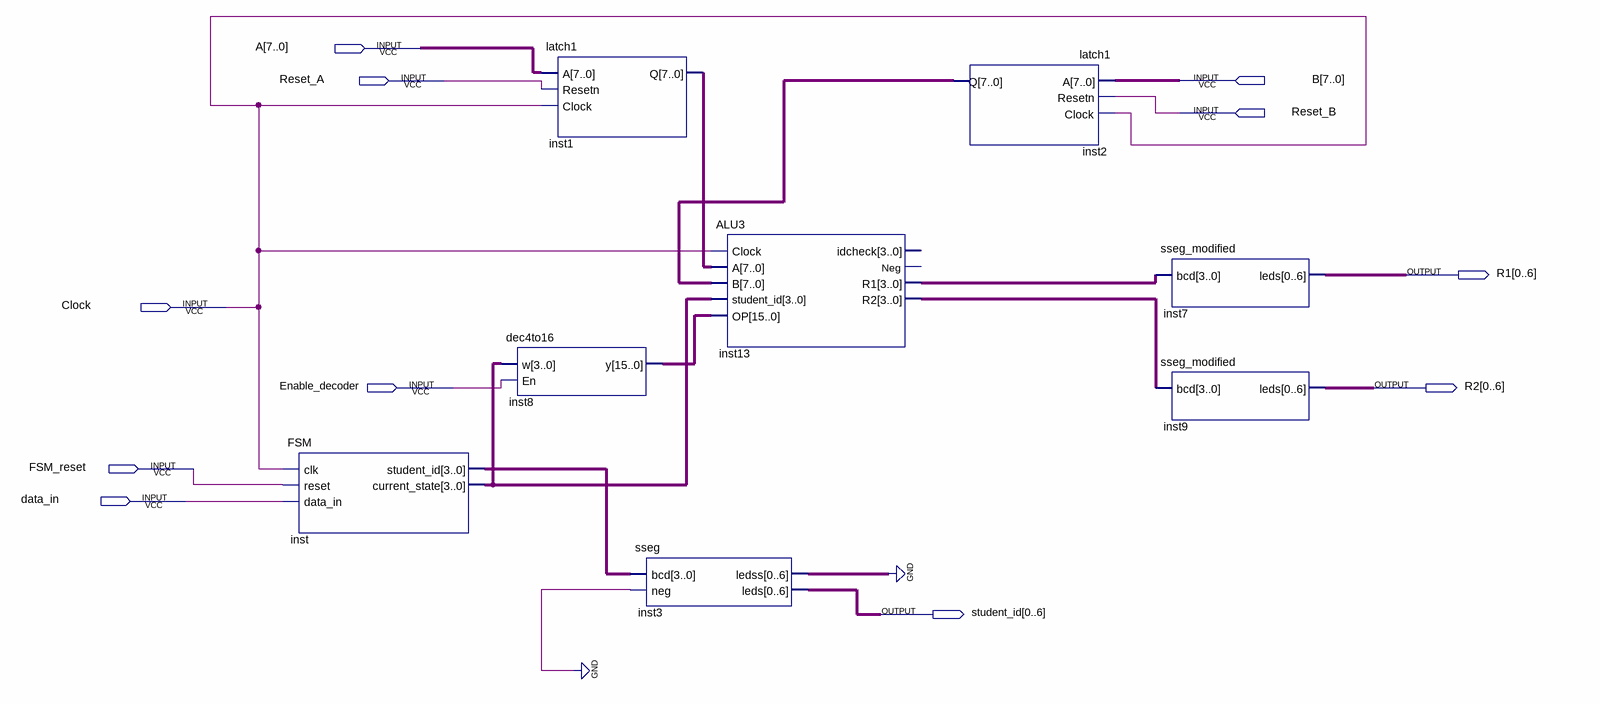
[diagram p0: schematic sheet]
// Quartus schematic lab6part3.bdf as structural Verilog: 8 symbols, 11 pins
module lab6part3 (
  input  [7:0] A,
  input  Reset_A,
  input  [7:0] B,
  input  Reset_B,
  input  Clock,
  input  Enable_decoder,
  input  FSM_reset,
  input  data_in,
  output [0:6] R1,
  output [0:6] R2,
  output [0:6] student_id
);

  wire [3:0] inst13_r1, inst13_r2, inst_current_state, inst_student_id;
  wire [6:0] inst3_ledss;
  wire [7:0] inst1_q, inst2_q;
  wire [15:0] inst8_y;

  FSM inst (
    .clk(Clock), .reset(FSM_reset), .data_in(data_in), .student_id(inst_student_id),
    .current_state(inst_current_state));
  latch1 inst1 (.A(A), .Resetn(Reset_A), .Clock(Clock), .Q(inst1_q));
  dec4to16 inst8 (.w(inst_current_state), .En(Enable_decoder), .y(inst8_y));
  sseg inst3 (.bcd(inst_student_id), .neg(1'b0), .ledss(inst3_ledss), .leds(student_id));
  ALU3 inst13 (
    .Clock(Clock), .A(inst1_q), .B(inst2_q), .student_id(inst_current_state), .OP(inst8_y), .R1(inst13_r1),
    .R2(inst13_r2));  // open: idcheck, Neg
  latch1 inst2 (.A(B), .Resetn(Reset_B), .Clock(Clock), .Q(inst2_q));
  sseg_modified inst7 (.bcd(inst13_r1), .leds(R1));
  sseg_modified inst9 (.bcd(inst13_r2), .leds(R2));
  // also tied to GND on the sheet: {inst3_ledss[0], inst3_ledss[1], inst3_ledss[2], inst3_ledss[3], inst3_ledss[4], inst3_ledss[5], inst3_ledss[6]}
endmodule
